# Altium project Robot_Project.PrjPcb
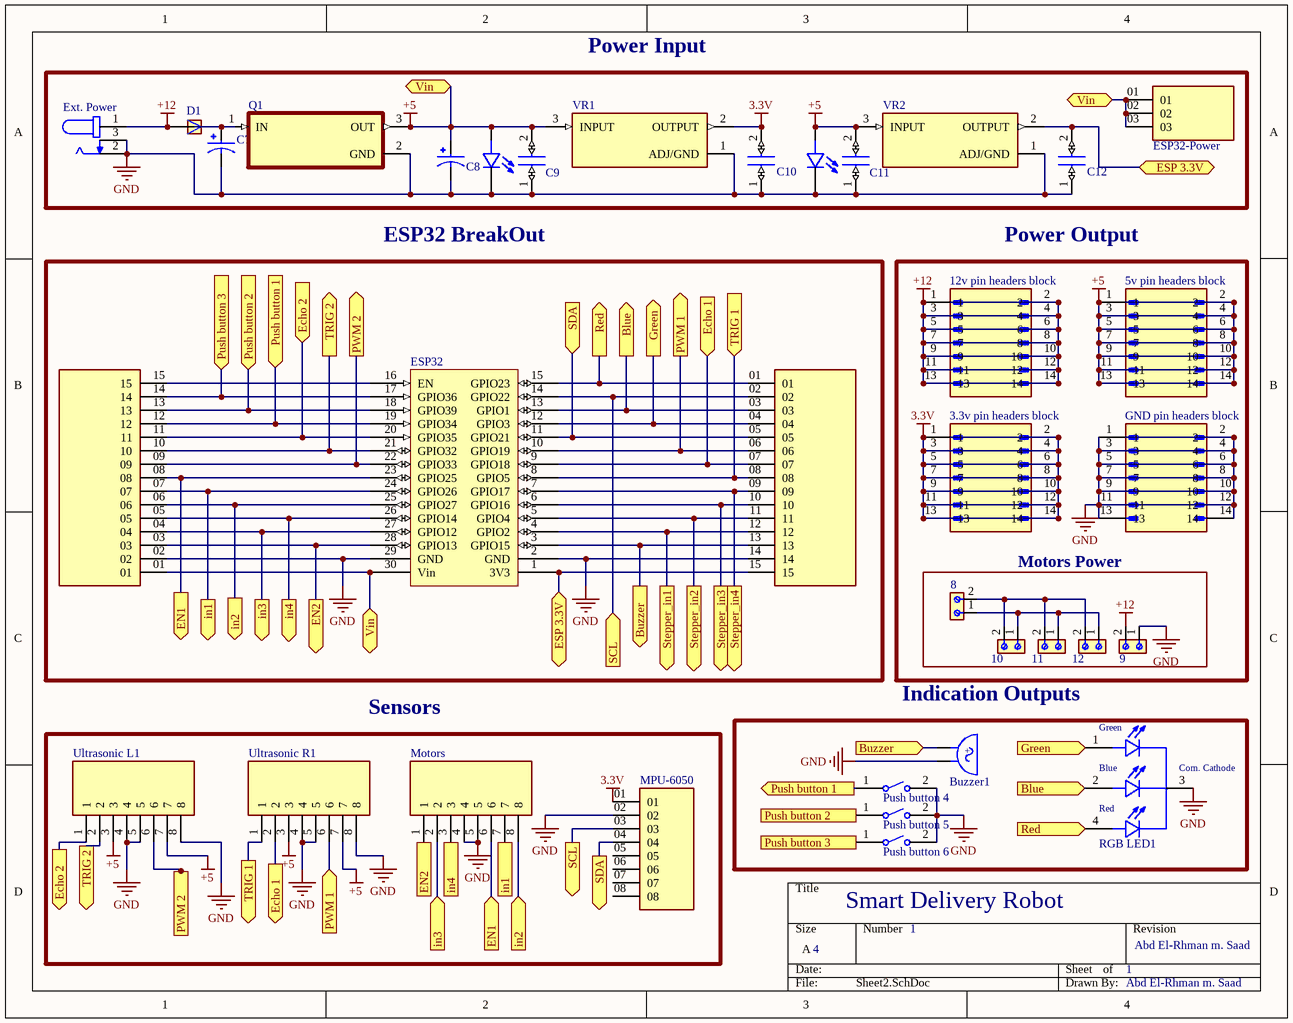
[diagram p0: Sheet2.SchDoc]
2 sheets, 75 parts. Net scope: flat (ports and power ports of the same name join across sheets).
Board file: PCB1.PcbDoc
Sheets:
  Sheet2.SchDoc
  Sheet1_draft.SchDoc

## Sheet Sheet2.SchDoc: Smart Delivery Robot
size A; Date: 27/12/2023; DrawnBy: Abd El-Rhman m. Saad; Engineer: Abd El-Rhman m. Saad; SheetNumber: 2; SheetTotal: 2

### Parts
(Parts that share a designator on the sheet are numbered #1, #2 ... from top to bottom, then left to right.)
1  LED 5mm  [LED 5mm]  (value not drawn)
2  LED 5mm  [LED 5mm]  (value not drawn)
3.3v_pin_headers_block  3.3v pin headers block  [AMPHENOL_52601-S14-4LF]  (value not drawn)
5v_pin_headers_block  5v pin headers block  [AMPHENOL_52601-S14-4LF]  (value not drawn)
8  From Buck  [691213510002]  (value not drawn)
9  From Buck  [691213510002]  (value not drawn)
10  From Buck  [691213510002]  (value not drawn)
11  From Buck  [691213510002]  (value not drawn)
12  From Buck  [691213510002]  (value not drawn)
12v_pin_headers_block  12v pin headers block  [AMPHENOL_52601-S14-4LF]  (value not drawn)
Buzzer1  Buzzer  [Buzzer 5V]  (value not drawn)
C7  CAP  33UF 50V RADIAL  [CAP  33UF 50V RADIAL]  (value not drawn)
C8  CAP  33UF 50V RADIAL  [CAP  33UF 50V RADIAL]  (value not drawn)
C9  Ceramic Capacitor 100nF  [C320C]  (value not drawn)
C10  Ceramic Capacitor 100nF  [C320C]  (value not drawn)
C11  Ceramic Capacitor 100nF  [C320C]  (value not drawn)
C12  Ceramic Capacitor 100nF  [C320C]  (value not drawn)
D1  RL207  [DIOAD1300W80L670D310]  (value not drawn)
ESP32#1  ESP32DEVKITV1  [ESP32DEVKITV1]  (value not drawn)
ESP32-Power  TS-103-T-A-1  [SAMTEC_TS-103-T-A-1]  (value not drawn)
Ext._Power#1  DC Power Jack Female Socket  [DC Power Jack Female Socket]  (value not drawn)
GND_pin_headers_block  GND pin headers block  [AMPHENOL_52601-S14-4LF]  (value not drawn)
J1  TS-115-T-A-1  [SAMTEC_TS-115-T-A-1]  (value not drawn)
J2  TS-115-T-A-1  [SAMTEC_TS-115-T-A-1]  (value not drawn)
Motors  Pin header female block 8 pin  [Pin header female block 8 pin]  (value not drawn)
MPU-6050#1  MPU-6050  [MPU-6050]  (value not drawn)
Push_button_4  FSM8JRT  [TE_FSM8JRT]  (value not drawn)
Push_button_5  FSM8JRT  [TE_FSM8JRT]  (value not drawn)
Push_button_6  FSM8JRT  [TE_FSM8JRT]  (value not drawn)
Q1  LM7805CT  [TO254P1054X470X1955-3]  (value not drawn)
RGB_LED1  common cathode  [LED RGB 5mm]  (value not drawn)
Ultrasonic_L1  Pin header female block 8 pin  [Pin header female block 8 pin]  (value not drawn)
Ultrasonic_R1  Pin header female block 8 pin  [Pin header female block 8 pin]  (value not drawn)
VR1  LM1117T-3.3  [TO254P1054X470X1955-3]  (value not drawn)
VR2  LM1117T-3.3  [TO254P1054X470X1955-3]  (value not drawn)

### Blocks framed on the sheet
Power Input: 1 2 C7-C12 D1 ESP32-Power Ext._Power#1 Q1 VR1 VR2
ESP32 BreakOut: ESP32#1 J1 J2
Power Output: 3.3v_pin_headers_block 5v_pin_headers_block 12v_pin_headers_block GND_pin_headers_block
Motors Power: 8-12
Indication Outputs: Buzzer1 Push_button_4-Push_button_6 RGB_LED1
Sensors: Motors MPU-6050#1 Ultrasonic_L1 Ultrasonic_R1

### Ports
Blue (in, see Sheet1[2B], Sheet1[4B], Sheet2[2B]), Blue (out, see Sheet1[2B], Sheet1[4B], Sheet2[4D]), Buzzer (in, see Sheet1[2C], Sheet1[4A], Sheet2[2C]), Buzzer (out, see Sheet1[2C], Sheet1[4A], Sheet2[3C]), Echo 1 (in, see Sheet1[3B], Sheet1[4B], Sheet2[1D]), Echo 1 (out, see Sheet1[3B], Sheet1[4B], Sheet2[3B]), Echo 2 (in, see Sheet1[1B], Sheet1[3B], Sheet2[1D]), Echo 2 (out, see Sheet1[1B], Sheet1[3B], Sheet2[1B]), EN1 (in, see Sheet1[1C], Sheet1[4C], Sheet2[1C]), EN1 (out, see Sheet1[1C], Sheet1[4C], Sheet2[2D]), EN2 (in, see Sheet1[2C], Sheet1[4C], Sheet2[1C]), EN2 (out, see Sheet1[2C], Sheet1[4C], Sheet2[2D]), ESP 3.3V (bidir, see Sheet1[2C], Sheet1[3A], Sheet2[2C]), ESP 3.3V (bidir, see Sheet1[2C], Sheet1[3A], Sheet2[4A]), Green (in, see Sheet1[3B], Sheet1[4B], Sheet2[3B]), Green (out, see Sheet1[3B], Sheet1[4B], Sheet2[4C]), in1 (in, see Sheet1[1C], Sheet1[4C], Sheet2[1C]), in1 (out, see Sheet1[1C], Sheet1[4C], Sheet2[2D]), in2 (in, see Sheet1[1C], Sheet1[4C], Sheet2[1C]), in2 (out, see Sheet1[1C], Sheet1[4C], Sheet2[2D]), in3 (in, see Sheet1[1C], Sheet1[4C], Sheet2[1C]), in3 (out, see Sheet1[1C], Sheet1[4C], Sheet2[2D]), in4 (in, see Sheet1[1C], Sheet1[4C], Sheet2[1C]), in4 (out, see Sheet1[1C], Sheet1[4C], Sheet2[2D]), Push button 1 (in, see Sheet1[1B], Sheet1[4C], Sheet2[3D]), Push button 1 (out, see Sheet1[1B], Sheet1[4C], Sheet2[1B]), Push button 2 (in, see Sheet1[1B], Sheet1[4D], Sheet2[3D]), Push button 2 (out, see Sheet1[1B], Sheet1[4D], Sheet2[1B]), Push button 3 (in, see Sheet1[1B], Sheet1[4D], Sheet2[3D]), Push button 3 (out, see Sheet1[1B], Sheet1[4D], Sheet2[1B]), PWM 1 (in, see Sheet1[3B], Sheet1[4B], Sheet2[3B]), PWM 1 (out, see Sheet1[3B], Sheet1[4B], Sheet2[2D]), PWM 2 (in, see Sheet1[2B], Sheet1[4B], Sheet2[2B]), PWM 2 (out, see Sheet1[2B], Sheet1[4B], Sheet2[1D]), Red (in, see Sheet1[2B], Sheet1[4B], Sheet2[2B]), Red (out, see Sheet1[2B], Sheet1[4B], Sheet2[4D]), SCL (in, see Sheet1[2C], Sheet1[3C], Sheet2[2D]), SCL (out, see Sheet1[2C], Sheet1[3C], Sheet2[2C]), SDA (in, see Sheet1[2B], Sheet1[4C], Sheet2[2D]), SDA (out, see Sheet1[2B], Sheet1[4C], Sheet2[2B]), Stepper_in1 (out, see Sheet1[2C]), Stepper_in2 (out, see Sheet1[3C]), Stepper_in3 (out, see Sheet1[3C]), Stepper_in4 (out, see Sheet1[3C]), TRIG 1 (in, see Sheet1[3B], Sheet1[4B], Sheet2[1D]), TRIG 1 (out, see Sheet1[3B], Sheet1[4B], Sheet2[3B]), TRIG 2 (out, see Sheet1[1B], Sheet1[3B], Sheet2[1D]), TRIG 2 (out, see Sheet1[1B], Sheet1[3B], Sheet2[2B]), Vin (bidir, see Sheet1[2A], Sheet1[2C], Sheet2[2A], Sheet2[2C]), Vin (bidir, see Sheet1[2A], Sheet1[2C], Sheet2[2A], Sheet2[4A]), Vin (bidir, see Sheet1[2A], Sheet1[2C], Sheet2[2C], Sheet2[4A])

### Nets
3.3V: 3.3v_pin_headers_block.1 3.3v_pin_headers_block.2 3.3v_pin_headers_block.3 3.3v_pin_headers_block.4 3.3v_pin_headers_block.5 3.3v_pin_headers_block.6 3.3v_pin_headers_block.7 3.3v_pin_headers_block.8 3.3v_pin_headers_block.9 3.3v_pin_headers_block.10 3.3v_pin_headers_block.11 3.3v_pin_headers_block.12 3.3v_pin_headers_block.13 3.3v_pin_headers_block.14 C10.2 MPU-6050#1.01 VR1.2(OUTPUT)
+5: 1.A 2.A 5v_pin_headers_block.1 5v_pin_headers_block.2 5v_pin_headers_block.3 5v_pin_headers_block.4 5v_pin_headers_block.5 5v_pin_headers_block.6 5v_pin_headers_block.7 5v_pin_headers_block.8 5v_pin_headers_block.9 5v_pin_headers_block.10 5v_pin_headers_block.11 5v_pin_headers_block.12 5v_pin_headers_block.13 5v_pin_headers_block.14 C8.P C9.2 C11.2 ESP32#1.30(Vin) ESP32-Power.01 ESP32-Power.02 ESP32-Power.03 J2.01 Q1.3(OUT) Ultrasonic_L1.3 Ultrasonic_L1.7 Ultrasonic_R1.3 Ultrasonic_R1.7 VR1.3(INPUT) VR2.3(INPUT) ; port Vin
+12: 9.2 12v_pin_headers_block.1 12v_pin_headers_block.2 12v_pin_headers_block.3 12v_pin_headers_block.4 12v_pin_headers_block.5 12v_pin_headers_block.6 12v_pin_headers_block.7 12v_pin_headers_block.8 12v_pin_headers_block.9 12v_pin_headers_block.10 12v_pin_headers_block.11 12v_pin_headers_block.12 12v_pin_headers_block.13 12v_pin_headers_block.14 D1.A Ext._Power#1.1
GND: 1.C 2.C 9.1 Buzzer1.NEG C7.N C8.N C9.1 C10.1 C11.1 C12.1 ESP32#1.2(GND) ESP32#1.29(GND) Ext._Power#1.2 Ext._Power#1.3 GND_pin_headers_block.1 GND_pin_headers_block.2 GND_pin_headers_block.3 GND_pin_headers_block.4 GND_pin_headers_block.5 GND_pin_headers_block.6 GND_pin_headers_block.7 GND_pin_headers_block.8 GND_pin_headers_block.9 GND_pin_headers_block.10 GND_pin_headers_block.11 GND_pin_headers_block.12 GND_pin_headers_block.13 GND_pin_headers_block.14 J1.14 J2.02 Motors.4 Motors.5 MPU-6050#1.02 Push_button_4.2 Push_button_5.2 Push_button_6.2 Q1.2(GND) RGB_LED1.3(Com._Cathode) Ultrasonic_L1.4 Ultrasonic_L1.5 Ultrasonic_L1.8 Ultrasonic_R1.4 Ultrasonic_R1.5 Ultrasonic_R1.8 VR1.1(ADJ/GND) VR2.1(ADJ/GND)
Net8_1: 8.1 10.1 11.1 12.1
Net8_2: 8.2 10.2 11.2 12.2
NetBuzzer_POS: Buzzer1.POS ESP32#1.3(GPIO15) J1.13 ; port Buzzer
NetC5_2: C12.2 ESP32#1.1(3V3) J1.15 VR2.2(OUTPUT) ; port ESP 3.3V
NetC7_P: C7.P D1.C Q1.1(IN)
NetESP32#1_4: ESP32#1.4(GPIO2) J1.12 ; port Stepper_in1
NetESP32#1_5: ESP32#1.5(GPIO4) J1.11 ; port Stepper_in2
NetESP32#1_6: ESP32#1.6(GPIO16) J1.10 ; port Stepper_in3
NetESP32#1_7: ESP32#1.7(GPIO17) J1.09 ; port Stepper_in4
NetESP32#1_8: ESP32#1.8(GPIO5) J1.08 Ultrasonic_R1.1 ; port TRIG 1
NetESP32#1_9: ESP32#1.9(GPIO18) J1.07 Ultrasonic_R1.2 ; port Echo 1
NetESP32#1_10: ESP32#1.10(GPIO19) J1.06 Ultrasonic_R1.6 ; port PWM 1
NetESP32#1_11: ESP32#1.11(GPIO21) J1.05 MPU-6050#1.04 ; port SDA
NetESP32#1_12: ESP32#1.12(GPIO3) J1.04 RGB_LED1.1(Green) ; port Green
NetESP32#1_13: ESP32#1.13(GPIO1) J1.03 RGB_LED1.2(BLUE) ; port Blue
NetESP32#1_14: ESP32#1.14(GPIO22) J1.02 MPU-6050#1.03 ; port SCL
NetESP32#1_15: ESP32#1.15(GPIO23) J1.01 RGB_LED1.4(Red) ; port Red
NetESP32#1_16: ESP32#1.16(EN) J2.15
NetESP32#1_17: ESP32#1.17(GPIO36) J2.14 Push_button_6.1 ; port Push button 3
NetESP32#1_18: ESP32#1.18(GPIO39) J2.13 Push_button_5.1 ; port Push button 2
NetESP32#1_19: ESP32#1.19(GPIO34) J2.12 Push_button_4.1 ; port Push button 1
NetESP32#1_20: ESP32#1.20(GPIO35) J2.11 Ultrasonic_L1.1 ; port Echo 2
NetESP32#1_21: ESP32#1.21(GPIO32) J2.10 Ultrasonic_L1.2 ; port TRIG 2
NetESP32#1_22: ESP32#1.22(GPIO33) J2.09 Ultrasonic_L1.6 ; port PWM 2
NetESP32#1_23: ESP32#1.23(GPIO25) J2.08 Motors.6 ; port EN1
NetESP32#1_24: ESP32#1.24(GPIO26) J2.07 Motors.7 ; port in1
NetESP32#1_25: ESP32#1.25(GPIO27) J2.06 Motors.8 ; port in2
NetESP32#1_26: ESP32#1.26(GPIO14) J2.05 Motors.3 ; port in4
NetESP32#1_27: ESP32#1.27(GPIO12) J2.04 Motors.2 ; port in3
NetESP32#1_28: ESP32#1.28(GPIO13) J2.03 Motors.1 ; port EN2

Not connected (* = marked no-connect by the designer): MPU-6050#1 05 06 07 08

### Notes on the sheet
- 4
- 1
- (in symbol Buzzer 5V) +; -
- (in symbol LED RGB 5mm) Blue

### Library data of the parts
1 2 = LED 5mm: Red 623nm LED Indication - Discrete 1.9V Radial; MF: {'manufacturer': u'Wurth Elektronik'}; MP: 151054RS03000; Package: None; Price: None; Value: *; Availability: Unavailable
3.3v_pin_headers_block 5v_pin_headers_block 12v_pin_headers_block GND_pin_headers_block = 52601-S14-4LF: MF: {'manufacturer': u'Amphenol ICC (FCI)'}; Package: None; Price: None; Value: *; MP: 52601-S14-4LF; Availability: Unavailable
8-12 = Terminal Block: 2 Position Wire to Board Terminal Block Horizontal with Board 0.200 (5.08mm) Through Hole; MF: Wurth Electronics; SnapEDA_Link: https://www.snapeda.com/parts/691213510002/Wurth+Electronics/view-part/?ref=snap; Package: None; Value: *; MP: 691213510002; Check_prices: https://www.snapeda.com/parts/691213510002/Wurth+Electronics/view-part/?ref=eda
Buzzer1 = Buzzer 5V: BUZZER 2.3KHZ 4-6VDC; MF: {'manufacturer': u'Soberton Inc.'}; MP: WST-1205S; Package: None; Price: None; Value: *; Availability: Unavailable
C7 C8 = CAP  33UF 50V RADIAL: NHG-A; MF: {'manufacturer': u'Panasonic'}; MP: ECA1HHG330I; Package: None; Price: None; Value: *; Availability: Unavailable
C9-C12 = Ceramic Capacitor 100nF: 0.1ÂµF Â±20% 50V Ceramic Capacitor Z5U Radial; MF: KEMET; MP: C320C104M5U5TA; Package: Radial KEMET; Value: *; SnapEDA_Link: https://www.snapeda.com/parts/C320C104M5U5TA/KEMET/view-part/228184/?ref=snap; Price: None; Availability: Unavailable
D1 = RL207: Semiconductors and Actives, Power Diodes, Discretes (diodes, transistors, thyristors ...), Diodes; MF: {'manufacturer': u'Diodes Inc.'}; Package: None; Price: None; Value: *; MP: RL207; Availability: Unavailable
ESP32-Power = TS-103-T-A-1: MF: {'manufacturer': u'Samtec'}; Package: None; Price: None; Value: *; MP: TS-103-T-A-1; Availability: Unavailable
Ext._Power#1 = DC Power Jack Female Socket: 2.0 mm Center Pin, 2.5 A, Right Angle, Through Hole, Dc Power Jack Connector; MF: {'manufacturer': u'CUI Devices'}; MP: PJ-002A; Package: None; Price: None; Value: *; Availability: Unavailable
J1 J2 = TS-115-T-A-1: MF: {'manufacturer': u'Samtec'}; Package: None; Price: None; Value: *; MP: TS-115-T-A-1; Availability: Unavailable
Motors Ultrasonic_L1 Ultrasonic_R1 = Pin header female block 8 pin: MF: {'manufacturer': u'TE Connectivity'}; MP: 5-534998-4; Package: None; Price: None; Value: *; Availability: Unavailable
Push_button_4-Push_button_6 = FSM8JRT: Tactile Switches PUSHBUTTON SWITCH TACT; MF: {'manufacturer': u'TE Connectivity'}; Package: None; Price: None; Value: *; MP: FSM8JRT; Availability: Unavailable
Q1 = LM7805CT/NOPB: MF: {'manufacturer': u'Texas Instruments'}; Package: None; Price: None; Value: *; MP: LM7805CT/NOPB; Availability: Unavailable
RGB_LED1 = LED RGB 5mm: MF: {'manufacturer': u'Kingbright'}; MP: WP154A4SUREQBFZGC; Package: None; Price: None; Value: *; Availability: Unavailable
VR1 VR2 = LM1117T-3.3/NOPB: MF: {'manufacturer': u'Texas Instruments'}; Package: None; Price: None; Value: *; MP: LM1117T-3.3/NOPB; Availability: Unavailable

## Sheet Sheet1_draft.SchDoc
size A; SheetNumber: 1; SheetTotal: 1
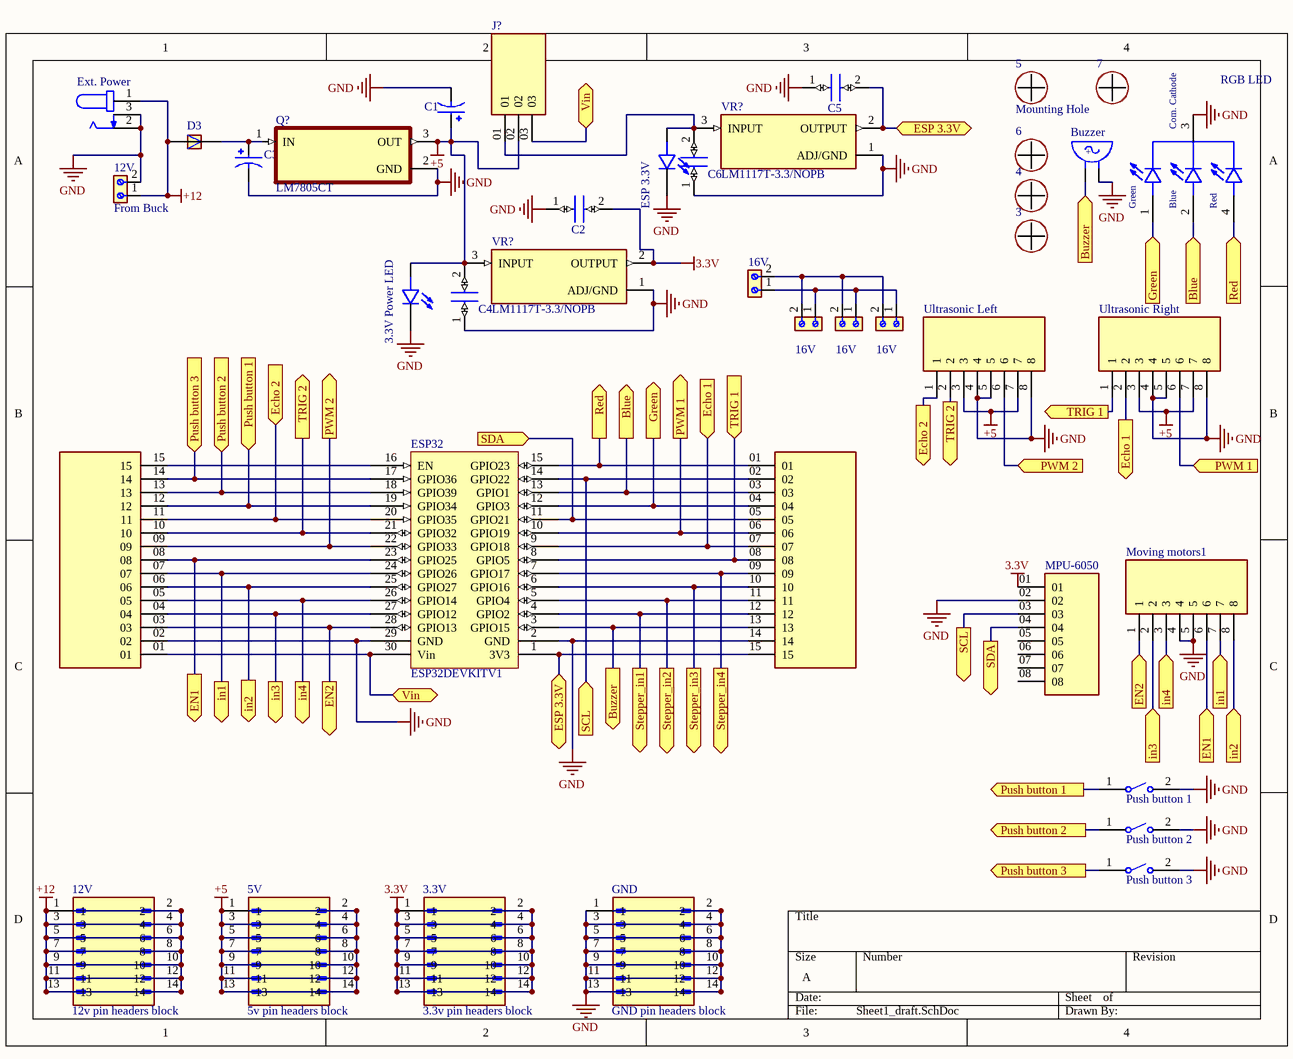
[diagram p1: Sheet1_draft.SchDoc]

### Parts
(Parts that share a designator on the sheet are numbered #1, #2 ... from top to bottom, then left to right.)
3  Mounting Hole  [PCBComponent_1]  (value not drawn)
3.3V  3.3v pin headers block  [AMPHENOL_52601-S14-4LF]
3.3V_Power_LED  LED 5mm  [LED 5mm]  (value not drawn)
4  Mounting Hole  [PCBComponent_1]  (value not drawn)
5  Mounting Hole  [PCBComponent_1]
5V  5v pin headers block  [AMPHENOL_52601-S14-4LF]
6  Mounting Hole  [PCBComponent_1]  (value not drawn)
7  Mounting Hole  [PCBComponent_1]  (value not drawn)
12V#1  From Buck  [691213510002]
12V#2  12v pin headers block  [AMPHENOL_52601-S14-4LF]
16V#1  From Buck  [691213510002]  (value not drawn)
16V#2  From Buck  [691213510002]  (value not drawn)
16V#3  From Buck  [691213510002]  (value not drawn)
16V#4  From Buck  [691213510002]  (value not drawn)
Buzzer  Buzzer  [Buzzer 5V]  (value not drawn)
C1  CAP  33UF 50V RADIAL  [CAP  33UF 50V RADIAL]  (value not drawn)
C2  Ceramic Capacitor 100nF  [C320C]  (value not drawn)
C3  CAP  33UF 50V RADIAL  [CAP  33UF 50V RADIAL]  (value not drawn)
C4  Ceramic Capacitor 100nF  [C320C]  (value not drawn)
C5  Ceramic Capacitor 100nF  [C320C]  (value not drawn)
C6  Ceramic Capacitor 100nF  [C320C]  (value not drawn)
D3  RL207  [DIOAD1300W80L670D310]  (value not drawn)
ESP32#2  ESP32DEVKITV1  [ESP32DEVKITV1]
ESP_3.3V  LED 5mm  [LED 5mm]  (value not drawn)
Ext._Power#2  DC Power Jack Female Socket  [DC Power Jack Female Socket]  (value not drawn)
GND  GND pin headers block  [AMPHENOL_52601-S14-4LF]
J5  TS-115-T-A-1  [SAMTEC_TS-115-T-A-1]  (value not drawn)
J6  TS-115-T-A-1  [SAMTEC_TS-115-T-A-1]  (value not drawn)
J?  TS-103-T-A-1  [SAMTEC_TS-103-T-A-1]  (value not drawn)
Moving_motors1  Pin header female block 8 pin  [Pin header female block 8 pin]  (value not drawn)
MPU-6050#2  MPU-6050  [MPU-6050]  (value not drawn)
Push_button_1  FSM8JRT  [TE_FSM8JRT]  (value not drawn)
Push_button_2  FSM8JRT  [TE_FSM8JRT]  (value not drawn)
Push_button_3  FSM8JRT  [TE_FSM8JRT]  (value not drawn)
Q?  LM7805CT  [TO254P1054X470X1955-3]
RGB_LED  common cathode  [LED RGB 5mm]  (value not drawn)
Ultrasonic_Left  Pin header female block 8 pin  [Pin header female block 8 pin]  (value not drawn)
Ultrasonic_Right  Pin header female block 8 pin  [Pin header female block 8 pin]  (value not drawn)
VR?#1  LM1117T-3.3/NOPB  [TO254P1054X470X1955-3]
VR?#2  LM1117T-3.3/NOPB  [TO254P1054X470X1955-3]

### Ports
Blue (in, see Sheet1[2B]), Blue (out, see Sheet1[4B]), Buzzer (in, see Sheet1[2C]), Buzzer (out, see Sheet1[4A]), Echo 1 (in, see Sheet1[4B]), Echo 1 (out, see Sheet1[3B]), Echo 2 (in, see Sheet1[3B]), Echo 2 (out, see Sheet1[1B]), EN1 (in, see Sheet1[1C]), EN1 (out, see Sheet1[4C]), EN2 (in, see Sheet1[2C]), EN2 (out, see Sheet1[4C]), ESP 3.3V (bidir, see Sheet1[2C]), ESP 3.3V (bidir, see Sheet1[3A]), Green (in, see Sheet1[3B]), Green (out, see Sheet1[4B]), in1 (in, see Sheet1[1C]), in1 (out, see Sheet1[4C]), in2 (in, see Sheet1[1C]), in2 (out, see Sheet1[4C]), in3 (in, see Sheet1[1C]), in3 (out, see Sheet1[4C]), in4 (in, see Sheet1[1C]), in4 (out, see Sheet1[4C]), Push button 1 (in, see Sheet1[4C]), Push button 1 (out, see Sheet1[1B]), Push button 2 (in, see Sheet1[4D]), Push button 2 (out, see Sheet1[1B]), Push button 3 (in, see Sheet1[4D]), Push button 3 (out, see Sheet1[1B]), PWM 1 (in, see Sheet1[3B]), PWM 1 (out, see Sheet1[4B]), PWM 2 (in, see Sheet1[2B]), PWM 2 (out, see Sheet1[4B]), Red (in, see Sheet1[2B]), Red (out, see Sheet1[4B]), SCL (in, see Sheet1[3C]), SCL (out, see Sheet1[2C]), SDA (in, see Sheet1[4C]), SDA (out, see Sheet1[2B]), Stepper_in1 (out), Stepper_in2 (out), Stepper_in3 (out), Stepper_in4 (out), TRIG 1 (in, see Sheet1[4B]), TRIG 1 (out, see Sheet1[3B]), TRIG 2 (out, see Sheet1[1B]), TRIG 2 (out, see Sheet1[3B]), Vin (bidir, see Sheet1[2A]), Vin (bidir, see Sheet1[2C])

### Nets
3.3V: 3.3V.1 3.3V.2 3.3V.3 3.3V.4 3.3V.5 3.3V.6 3.3V.7 3.3V.8 3.3V.9 3.3V.10 3.3V.11 3.3V.12 3.3V.13 3.3V.14 C2.2 MPU-6050#2.01 VR?#2.2(OUTPUT)
+5: 3.3V_Power_LED.A 5V.1 5V.2 5V.3 5V.4 5V.5 5V.6 5V.7 5V.8 5V.9 5V.10 5V.11 5V.12 5V.13 5V.14 C1.P C4.2 ESP32#2.30(Vin) J6.01 J?.02 J?.03 Q?.3(OUT) Ultrasonic_Left.3 Ultrasonic_Left.7 Ultrasonic_Right.3 Ultrasonic_Right.7 VR?#2.3(INPUT) ; port Vin
+12: 12V#1.1 12V#2.1 12V#2.2 12V#2.3 12V#2.4 12V#2.5 12V#2.6 12V#2.7 12V#2.8 12V#2.9 12V#2.10 12V#2.11 12V#2.12 12V#2.13 12V#2.14 D3.A Ext._Power#2.1
GND: 3.3V_Power_LED.C 12V#1.2 Buzzer.NEG C1.N C2.1 C3.N C4.1 C5.1 C6.1 ESP32#2.2(GND) ESP32#2.29(GND) ESP_3.3V.C Ext._Power#2.2 Ext._Power#2.3 GND.1 GND.2 GND.3 GND.4 GND.5 GND.6 GND.7 GND.8 GND.9 GND.10 GND.11 GND.12 GND.13 GND.14 J5.14 J6.02 Moving_motors1.4 Moving_motors1.5 MPU-6050#2.02 Push_button_1.2 Push_button_2.2 Push_button_3.2 Q?.2(GND) RGB_LED.3(Com._Cathode) Ultrasonic_Left.4 Ultrasonic_Left.5 Ultrasonic_Left.8 Ultrasonic_Right.4 Ultrasonic_Right.5 Ultrasonic_Right.8 VR?#1.1(ADJ/GND) VR?#2.1(ADJ/GND)
Net16V#1_1: 16V#1.1 16V#2.1 16V#3.1 16V#4.1
Net16V#1_2: 16V#1.2 16V#2.2 16V#3.2 16V#4.2
NetBuzzer_POS: Buzzer.POS ESP32#2.3(GPIO15) J5.13 ; port Buzzer
NetC3_P: C3.P D3.C Q?.1(IN)
NetC5_2: C5.2 ESP32#2.1(3V3) J5.15 VR?#1.2(OUTPUT) ; port ESP 3.3V
NetC6_2: C6.2 ESP_3.3V.A J?.01 VR?#1.3(INPUT)
NetESP32#1_4: ESP32#2.4(GPIO2) J5.12 ; port Stepper_in1
NetESP32#1_5: ESP32#2.5(GPIO4) J5.11 ; port Stepper_in2
NetESP32#1_6: ESP32#2.6(GPIO16) J5.10 ; port Stepper_in3
NetESP32#1_7: ESP32#2.7(GPIO17) J5.09 ; port Stepper_in4
NetESP32#1_8: ESP32#2.8(GPIO5) J5.08 Ultrasonic_Right.1 ; port TRIG 1
NetESP32#1_9: ESP32#2.9(GPIO18) J5.07 Ultrasonic_Right.2 ; port Echo 1
NetESP32#1_10: ESP32#2.10(GPIO19) J5.06 Ultrasonic_Right.6 ; port PWM 1
NetESP32#1_11: ESP32#2.11(GPIO21) J5.05 MPU-6050#2.04 ; port SDA
NetESP32#1_12: ESP32#2.12(GPIO3) J5.04 RGB_LED.1(Green) ; port Green
NetESP32#1_13: ESP32#2.13(GPIO1) J5.03 RGB_LED.2(BLUE) ; port Blue
NetESP32#1_14: ESP32#2.14(GPIO22) J5.02 MPU-6050#2.03 ; port SCL
NetESP32#1_15: ESP32#2.15(GPIO23) J5.01 RGB_LED.4(Red) ; port Red
NetESP32#1_17: ESP32#2.17(GPIO36) J6.14 Push_button_3.1 ; port Push button 3
NetESP32#1_18: ESP32#2.18(GPIO39) J6.13 Push_button_2.1 ; port Push button 2
NetESP32#1_19: ESP32#2.19(GPIO34) J6.12 Push_button_1.1 ; port Push button 1
NetESP32#1_20: ESP32#2.20(GPIO35) J6.11 Ultrasonic_Left.1 ; port Echo 2
NetESP32#1_21: ESP32#2.21(GPIO32) J6.10 Ultrasonic_Left.2 ; port TRIG 2
NetESP32#1_22: ESP32#2.22(GPIO33) J6.09 Ultrasonic_Left.6 ; port PWM 2
NetESP32#1_23: ESP32#2.23(GPIO25) J6.08 Moving_motors1.6 ; port EN1
NetESP32#1_24: ESP32#2.24(GPIO26) J6.07 Moving_motors1.7 ; port in1
NetESP32#1_25: ESP32#2.25(GPIO27) J6.06 Moving_motors1.8 ; port in2
NetESP32#1_26: ESP32#2.26(GPIO14) J6.05 Moving_motors1.3 ; port in4
NetESP32#1_27: ESP32#2.27(GPIO12) J6.04 Moving_motors1.2 ; port in3
NetESP32#1_28: ESP32#2.28(GPIO13) J6.03 Moving_motors1.1 ; port EN2
NetESP32#2_16: ESP32#2.16(EN) J6.15

Not connected (* = marked no-connect by the designer): MPU-6050#2 05 06 07 08

### Notes on the sheet
- (in symbol Buzzer 5V) +; -
- (in symbol LED RGB 5mm) Blue

### Library data of the parts
3.3V 5V 12V#2 GND = 52601-S14-4LF: as 3.3v_pin_headers_block on sheet Sheet2; Package: None; Price: None; Value: *; MP: 52601-S14-4LF; Availability: Unavailable
3.3V_Power_LED ESP_3.3V = LED 5mm: as 1 on sheet Sheet2; Package: None; Price: None; Value: *; Availability: Unavailable
12V#1 16V#1-16V#4 = Terminal Block: as 8 on sheet Sheet2; SnapEDA_Link: https://www.snapeda.com/parts/691213510002/Wurth+Electronics/view-part/?ref=snap; Package: None; Value: *; MP: 691213510002; Check_prices: https://www.snapeda.com/parts/691213510002/Wurth+Electronics/view-part/?ref=eda
Buzzer = Buzzer 5V: as Buzzer1 on sheet Sheet2; Package: None; Price: None; Value: *; Availability: Unavailable
C1 C3 = CAP  33UF 50V RADIAL: as C7 on sheet Sheet2; Package: None; Price: None; Value: *; Availability: Unavailable
C2 C4-C6 = Ceramic Capacitor 100nF: as C9 on sheet Sheet2; Package: Radial KEMET; Value: *; SnapEDA_Link: https://www.snapeda.com/parts/C320C104M5U5TA/KEMET/view-part/228184/?ref=snap; Price: None; Availability: Unavailable
D3 = RL207: as D1 on sheet Sheet2; Package: None; Price: None; Value: *; MP: RL207; Availability: Unavailable
Ext._Power#2 = DC Power Jack Female Socket: as Ext._Power#1 on sheet Sheet2; Package: None; Price: None; Value: *; Availability: Unavailable
J5 J6 = TS-115-T-A-1: MF: {'manufacturer': u'Samtec'}; Package: None; Price: None; Value: *; MP: TS-115-T-A-1; Availability: Unavailable
J? = TS-103-T-A-1: MF: {'manufacturer': u'Samtec'}; Package: None; Price: None; Value: *; MP: TS-103-T-A-1; Availability: Unavailable
Moving_motors1 Ultrasonic_Left Ultrasonic_Right = Pin header female block 8 pin: as Motors on sheet Sheet2; Package: None; Price: None; Value: *; Availability: Unavailable
Push_button_1-Push_button_3 = FSM8JRT: as Push_button_4 on sheet Sheet2; Package: None; Price: None; Value: *; MP: FSM8JRT; Availability: Unavailable
Q? = LM7805CT/NOPB: as Q1 on sheet Sheet2; Package: None; Price: None; Value: *; MP: LM7805CT/NOPB; Availability: Unavailable
RGB_LED = LED RGB 5mm: as RGB_LED1 on sheet Sheet2; Package: None; Price: None; Value: *; Availability: Unavailable
VR?#1 VR?#2 = LM1117T-3.3/NOPB: as VR1 on sheet Sheet2; Package: None; Price: None; Value: *; MP: LM1117T-3.3/NOPB; Availability: Unavailable

## Nets that join several sheets
3.3V: Sheet2 (17 pins), Sheet1_draft (17 pins)
+5: Sheet2 (31 pins), Sheet1_draft (27 pins)
+12: Sheet2 (17 pins), Sheet1_draft (17 pins)
GND: Sheet2 (46 pins), Sheet1_draft (46 pins)
NetBuzzer_POS: Sheet2 (Buzzer1.POS ESP32#1.3 J1.13), Sheet1_draft (Buzzer.POS ESP32#2.3 J5.13)
NetC5_2: Sheet2 (C12.2 ESP32#1.1 J1.15 VR2.2), Sheet1_draft (C5.2 ESP32#2.1 J5.15 VR?#1.2)
NetESP32#1_4: Sheet2 (ESP32#1.4 J1.12), Sheet1_draft (ESP32#2.4 J5.12)
NetESP32#1_5: Sheet2 (ESP32#1.5 J1.11), Sheet1_draft (ESP32#2.5 J5.11)
NetESP32#1_6: Sheet2 (ESP32#1.6 J1.10), Sheet1_draft (ESP32#2.6 J5.10)
NetESP32#1_7: Sheet2 (ESP32#1.7 J1.09), Sheet1_draft (ESP32#2.7 J5.09)
NetESP32#1_8: Sheet2 (ESP32#1.8 J1.08 Ultrasonic_R1.1), Sheet1_draft (ESP32#2.8 J5.08 Ultrasonic_Right.1)
NetESP32#1_9: Sheet2 (ESP32#1.9 J1.07 Ultrasonic_R1.2), Sheet1_draft (ESP32#2.9 J5.07 Ultrasonic_Right.2)
NetESP32#1_10: Sheet2 (ESP32#1.10 J1.06 Ultrasonic_R1.6), Sheet1_draft (ESP32#2.10 J5.06 Ultrasonic_Right.6)
NetESP32#1_11: Sheet2 (ESP32#1.11 J1.05 MPU-6050#1.04), Sheet1_draft (ESP32#2.11 J5.05 MPU-6050#2.04)
NetESP32#1_12: Sheet2 (ESP32#1.12 J1.04 RGB_LED1.1), Sheet1_draft (ESP32#2.12 J5.04 RGB_LED.1)
NetESP32#1_13: Sheet2 (ESP32#1.13 J1.03 RGB_LED1.2), Sheet1_draft (ESP32#2.13 J5.03 RGB_LED.2)
NetESP32#1_14: Sheet2 (ESP32#1.14 J1.02 MPU-6050#1.03), Sheet1_draft (ESP32#2.14 J5.02 MPU-6050#2.03)
NetESP32#1_15: Sheet2 (ESP32#1.15 J1.01 RGB_LED1.4), Sheet1_draft (ESP32#2.15 J5.01 RGB_LED.4)
NetESP32#1_17: Sheet2 (ESP32#1.17 J2.14 Push_button_6.1), Sheet1_draft (ESP32#2.17 J6.14 Push_button_3.1)
NetESP32#1_18: Sheet2 (ESP32#1.18 J2.13 Push_button_5.1), Sheet1_draft (ESP32#2.18 J6.13 Push_button_2.1)
NetESP32#1_19: Sheet2 (ESP32#1.19 J2.12 Push_button_4.1), Sheet1_draft (ESP32#2.19 J6.12 Push_button_1.1)
NetESP32#1_20: Sheet2 (ESP32#1.20 J2.11 Ultrasonic_L1.1), Sheet1_draft (ESP32#2.20 J6.11 Ultrasonic_Left.1)
NetESP32#1_21: Sheet2 (ESP32#1.21 J2.10 Ultrasonic_L1.2), Sheet1_draft (ESP32#2.21 J6.10 Ultrasonic_Left.2)
NetESP32#1_22: Sheet2 (ESP32#1.22 J2.09 Ultrasonic_L1.6), Sheet1_draft (ESP32#2.22 J6.09 Ultrasonic_Left.6)
NetESP32#1_23: Sheet2 (ESP32#1.23 J2.08 Motors.6), Sheet1_draft (ESP32#2.23 J6.08 Moving_motors1.6)
NetESP32#1_24: Sheet2 (ESP32#1.24 J2.07 Motors.7), Sheet1_draft (ESP32#2.24 J6.07 Moving_motors1.7)
NetESP32#1_25: Sheet2 (ESP32#1.25 J2.06 Motors.8), Sheet1_draft (ESP32#2.25 J6.06 Moving_motors1.8)
NetESP32#1_26: Sheet2 (ESP32#1.26 J2.05 Motors.3), Sheet1_draft (ESP32#2.26 J6.05 Moving_motors1.3)
NetESP32#1_27: Sheet2 (ESP32#1.27 J2.04 Motors.2), Sheet1_draft (ESP32#2.27 J6.04 Moving_motors1.2)
NetESP32#1_28: Sheet2 (ESP32#1.28 J2.03 Motors.1), Sheet1_draft (ESP32#2.28 J6.03 Moving_motors1.1)